# Altium schematic sheet Light_Detection.SchDoc
size A4; Date: *******; ApprovedBy: *******; CheckedBy: None; Author: *******; CompanyName: *******; DrawnBy: Name; Engineer: *******; Organization: *******; Address1: *******; Address2: *******; Address3: *******; Address4: *******; DocumentNumber: Doc Num; Revision: *******; SheetNumber: 6; SheetTotal: 7; CurrentTime: *******; CurrentDate: *******; Time: *******; DocumentFullPathAndName: *******; DocumentName: *******; ModifiedDate: *******; ImagePath: *******; ProjectName: *******; Application_BuildNumber: *******
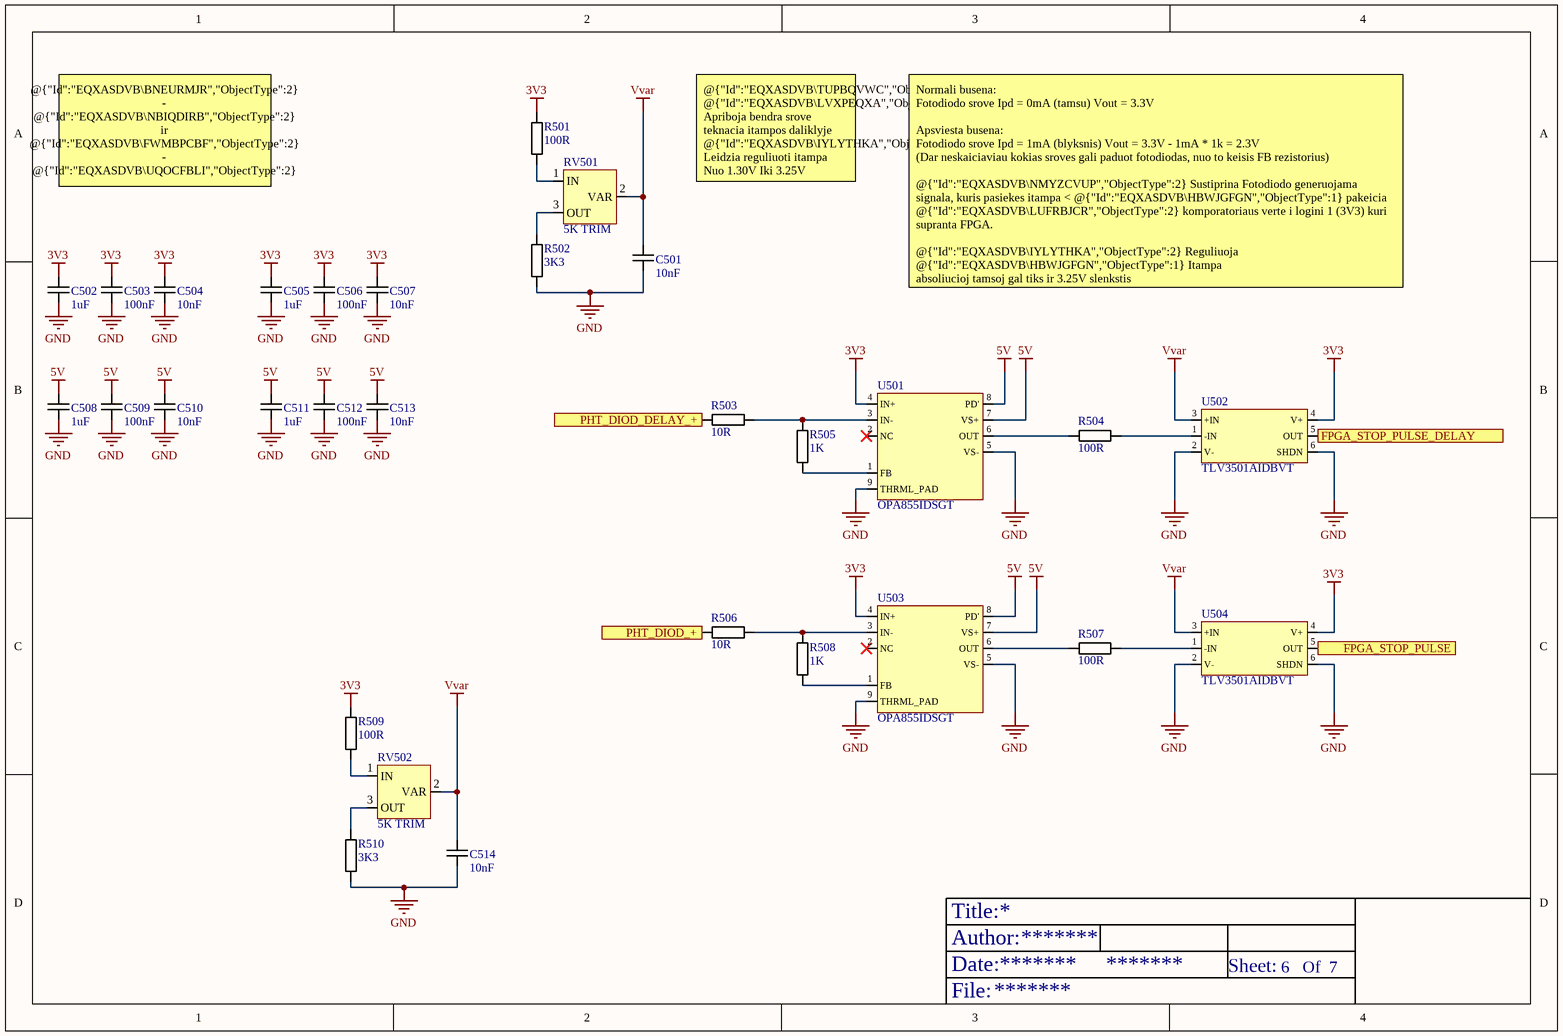
[diagram p0: Light_Detection.SchDoc]

## Parts
C501  10nF  [10nF 0402]
C502  1uF  [1uF 0603]
C503  100nF  [100nF 0402]
C504  10nF  [10nF 0402]
C505  1uF  [1uF 0603]
C506  100nF  [100nF 0402]
C507  10nF  [10nF 0402]
C508  1uF  [1uF 0603]
C509  100nF  [100nF 0402]
C510  10nF  [10nF 0402]
C511  1uF  [1uF 0603]
C512  100nF  [100nF 0402]
C513  10nF  [10nF 0402]
C514  10nF  [10nF 0402]
R501  100R  [100R 0402]
R502  3K3  [3k3 0402]
R503  10R  [10R 0402]
R504  100R  [100R 0402]
R505  1K  [1k 0603]
R506  10R  [10R 0402]
R507  100R  [100R 0402]
R508  1K  [1k 0603]
R509  100R  [100R 0402]
R510  3K3  [3k3 0402]
RV501  5K TRIM  [5K TRIM]
RV502  5K TRIM  [5K TRIM]
U501  OPA855IDSGT  [OPA855IDSGT]
U502  TLV3501AIDBVT  [TLV3501AIDBVT]
U503  OPA855IDSGT  [OPA855IDSGT]
U504  TLV3501AIDBVT  [TLV3501AIDBVT]

## Ports
FPGA_STOP_PULSE (see Inputs_Outputs[4C]), FPGA_STOP_PULSE_DELAY (see Inputs_Outputs[4B]), PHT_DIOD_+ (see Laser_System[3C]), PHT_DIOD_DELAY_+ (see Laser_System[3B])

## Nets
3V3: C502.2 C503.2 C504.2 C505.2 C506.2 C507.2 R501.1 R509.1 U501.4(IN+) U502.4(V+) U503.4(IN+) U504.4(V+)
5V: C508.2 C509.2 C510.2 C511.2 C512.2 C513.2 U501.7(VS+) U501.8(PD') U503.7(VS+) U503.8(PD')
GND: C501.1 C502.1 C503.1 C504.1 C505.1 C506.1 C507.1 C508.1 C509.1 C510.1 C511.1 C512.1 C513.1 C514.1 R502.2 R510.2 U501.5(VS-) U501.9(THRML_PAD) U502.2(V-) U502.6(SHDN) U503.5(VS-) U503.9(THRML_PAD) U504.2(V-) U504.6(SHDN)
Vvar: C501.2 C514.2 RV501.2(VAR) RV502.2(VAR) U502.3(+IN) U504.3(+IN)
FPGA_STOP_PULSE: U504.5(OUT) ; port FPGA_STOP_PULSE
FPGA_STOP_PULSE_DELAY: U502.5(OUT) ; port FPGA_STOP_PULSE_DELAY
PHT_DIOD_+: R506.1 ; port PHT_DIOD_+
PHT_DIOD_DELAY_+: R503.1 ; port PHT_DIOD_DELAY_+
NetR501_2: R501.2 RV501.1(IN)
NetR502_1: R502.1 RV501.3(OUT)
NetR503_2: R503.2 R505.1 U501.3(IN-)
NetR504_1: R504.1 U501.6(OUT)
NetR504_2: R504.2 U502.1(-IN)
NetR505_2: R505.2 U501.1(FB)
NetR506_2: R506.2 R508.1 U503.3(IN-)
NetR507_1: R507.1 U503.6(OUT)
NetR507_2: R507.2 U504.1(-IN)
NetR508_2: R508.2 U503.1(FB)
NetR509_2: R509.2 RV502.1(IN)
NetR510_1: R510.1 RV502.3(OUT)

Not connected (* = marked no-connect by the designer): U501 2(NC)*; U503 2(NC)*

## Notes on the sheet
- @{"Id":"EQXASDVB\BNEURMJR","ObjectType":2} - @{"Id":"EQXASDVB\NBIQDIRB","ObjectType":2} ir @{"Id":"EQXASDVB\FWMBPCBF","ObjectType":2} - @{"Id":"EQXASDVB\UQOCFBLI","ObjectType":2}
  Reikalingi filtravimui, bei stabilios itampos islaikymui.
  Kiekviena eile kondensatoriu lituojasi kuo arciau mikruskes
  @{"Id":"EQXASDVB\NMYZCVUP","ObjectType":2} - @{"Id":"EQXASDVB\AOQOIBQK","ObjectType":2}
- @{"Id":"EQXASDVB\TUPBQVWC","ObjectType":2} @{"Id":"EQXASDVB\LVXPEQXA","ObjectType":2} Apriboja bendra srove teknacia itampos daliklyje
  @{"Id":"EQXASDVB\IYLYTHKA","ObjectType":2} Leidzia reguliuoti itampa
  Nuo 1.30V Iki 3.25V
- Normali busena:
  Fotodiodo srove Ipd = 0mA (tamsu) Vout = 3.3V
  Apsviesta busena:
  Fotodiodo srove Ipd = 1mA (blyksnis) Vout = 3.3V - 1mA * 1k = 2.3V
  (Dar neskaiciaviau kokias sroves gali paduot fotodiodas, nuo to keisis FB rezistorius)
  @{"Id":"EQXASDVB\NMYZCVUP","ObjectType":2} Sustiprina Fotodiodo generuojama signala, kuris pasiekes itampa < @{"Id":"EQXASDVB\HBWJGFGN","ObjectType":1} pakeicia @{"Id":"EQXASDVB\LUFRBJCR","ObjectType":2} komporatoriaus verte i logini 1 (3V3) kuri supranta FPGA.
  @{"Id":"EQXASDVB\IYLYTHKA","ObjectType":2} Reguliuoja @{"Id":"EQXASDVB\HBWJGFGN","ObjectType":1} Itampa
  absoliucioj tamsoj gal tiks ir 3.25V slenkstis
  Apsviestam kambari gali but reikes ir 1.30V slenkscio
- Title:
- Date:
- Author:
- Sheet:
- Of
- File:

## Library data of the parts
C501 C504 C507 C510 C513 C514 = 10nF 0402: C0402C103J5RACTU
C502 C505 C508 C511 = 1uF 0603: CGA3E1X7R1E105K080AC
C503 C506 C509 C512 = 100n 0402: C1005X7R1E104K050BB
R501 R504 R507 R509 = 100R 0402: ERA-2VEB1000X
R502 R510 = 3K3 0402: ERJ-U02F3301X
R503 R506 = 10R 0402: CRT0402-DZ-10R0GLF
R505 R508 = 1K 0603: ERA-3AEB102V
RV501 RV502 = 5K TRIM: 3314G-1-502E
U501 U503 = OPA855IDSGT: OP ampas
U502 U504 = TLV3501AIDBVT: Comparatorius